# EasyEDA Pro project test_psu.epro, board PowerStagePCB
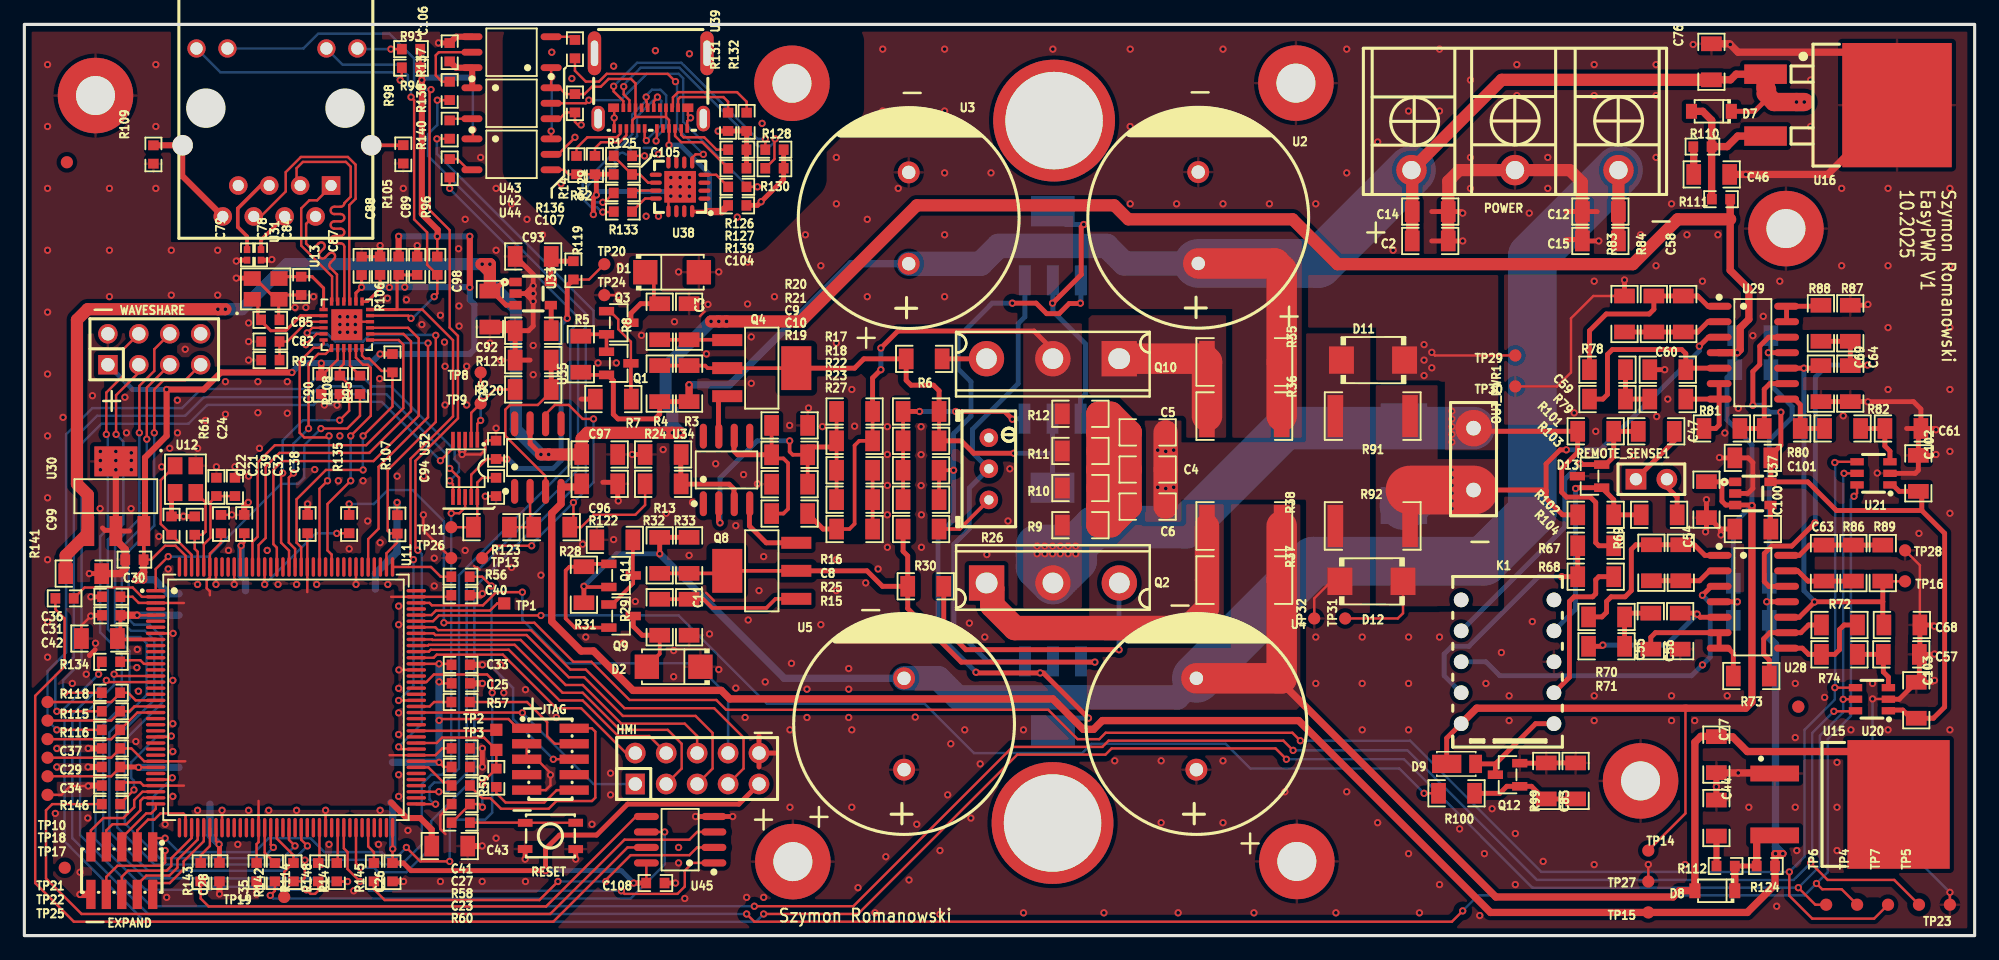
[diagram p0: board, top side]
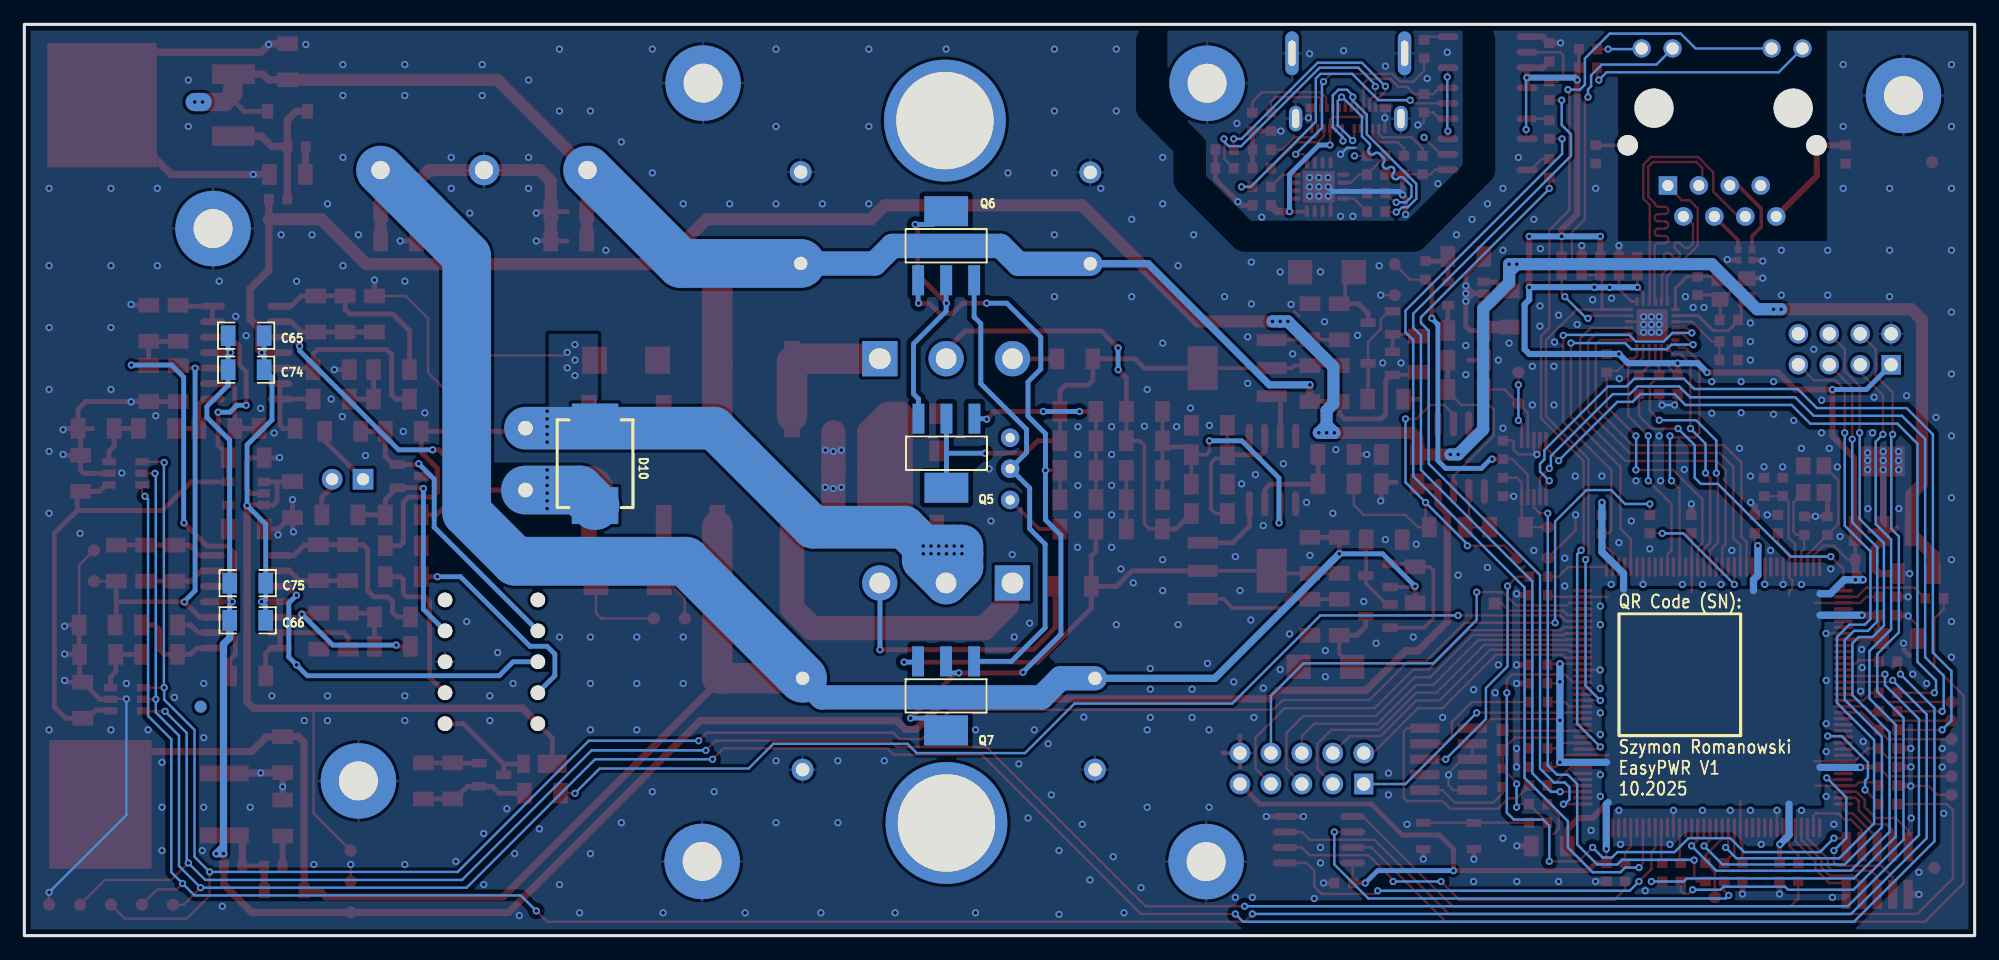
[diagram p1: board, bottom side, seen from below]

Outline 160.15 x 74.8 mm; copper layers: Top Layer, Inner1, Inner2, Bottom Layer. Coordinates in mm from the lower left corner of the outline.
Outline path: rectangle 160.15,0 0,74.8
Stack: Top Layer 0.035mm Outer layer thickness 1oz / Dielectric1 0.2104mm 7628 RC49% 8.6mil / Inner1 0.0152mm Inner layer thickness / Dielectric2 1.065mm 1.1mm H/HOZ Copper / Inner2 0.0152mm Inner layer thickness / Dielectric3 0.2104mm 7628 RC49% 8.6mil / Bottom Layer 0.035mm Outer layer thickness 1oz

## Design rules (mm)
net GND: SlowClass
net GATE_A: FastClass
net VCC-: SlowClass
net VCC+: SlowClass
net GATE_B: FastClass
net $C3_2: SlowClass
net $C4_1: SlowClass
net $C10_1: SlowClass
net $C8_1: SlowClass
net $C10_2: SlowClass
net $C11_1: SlowClass
net $D1_1: SlowClass
net $D2_2: SlowClass
net $Q1_1: SlowClass
net $Q1_3: SlowClass
net $Q2_3: SlowClass
net $Q4_3: SlowClass
net $Q5_1: FastClass
net $Q5_3: FastClass
net $Q6_1: FastClass
net $Q6_3: FastClass
net $Q8_3: SlowClass
net $Q11_3: SlowClass
net $Q11_1: SlowClass
net $Q10_3: SlowClass
net $R26_3: SlowClass
net USETIN: SlowClass
net $R13_1: SlowClass
net $Q2_1: SlowClass
net $Q10_1: SlowClass
net UOH: SlowClass
net UOL: SlowClass
net XOUT: FastClass
net XIN: FastClass
net NRESET: SlowClass
net $C24_2: FastClass
net 3V3: SlowClass
net VDDCORE: SlowClass
net -5V: SlowClass
net +5V: SlowClass
net SWO: SlowClass
net $R56_1: SlowClass
net SWDCLK: SlowClass
net $R57_1: SlowClass
net SWDIO: SlowClass
net $R58_1: SlowClass
net $R59_1: SlowClass
net $R60_1: SlowClass
net $TP1_1: SlowClass
net $TP2_1: SlowClass
net KEY: SlowClass
net SCL: SlowClass
net SDA: SlowClass
net $C55_1: SlowClass
net $C55_2: SlowClass
net $C57_2: SlowClass
net 3V3_REF: SlowClass
net $C61_2: SlowClass
net $C54_2: SlowClass
net $C54_1: SlowClass
net $C56_2: SlowClass
net $C58_2: SlowClass
net $C58_1: SlowClass
net $C59_2: SlowClass
net $C59_1: SlowClass
net $C60_2: SlowClass
net $C63_2: SlowClass
net $C63_1: SlowClass
net $C64_2: SlowClass
net U075: SlowClass
net $R72_2: SlowClass
net $R72_1: SlowClass
net $R80_2: SlowClass
net $R80_1: SlowClass
net $R88_2: SlowClass
net 1V2: SlowClass
net REXT: SlowClass
net $R95_1: SlowClass
net ETHLEDG: SlowClass
net $C78_2: SlowClass
net $C79_2: SlowClass
net $R93_1: SlowClass
net $R94_1: SlowClass
net $R98_1: SlowClass
net LOCAL_SENSE: SlowClass
net LOCAL_GND: SlowClass
net USENSE: SlowClass
net $D9_2: SlowClass
net REMOTE_SENSE: SlowClass
net REMOTE_GND: SlowClass
net SENSE_DIR: SlowClass
net $C83_2: SlowClass
net PD0_PHYRCLK: FastClass
net PC8_LANLED: SlowClass
net PHY_XO: SlowClass
net PHY_XI: SlowClass
net PD9_MDIO: FastClass
net PD8_MDC: FastClass
net PD5_PHYRX0: FastClass
net PD4_PHYAD1: FastClass
net PD7_PHYRXER: SlowClass
net PA14_PHYINT: FastClass
net PD1_PHYTXEN: FastClass
net PD2_PHYTX0: FastClass
net PD3_PHYTX1: FastClass
net PC10_PHYRST: SlowClass
net ETH_RXM-: SlowClass, DP2
net ETH_RXP+: SlowClass, DP2
net ETH_TXM-: SlowClass, DP1
net ETH_TXP+: SlowClass, DP1
net PD6_PHYRX1: FastClass
net $R109_1: SlowClass
net LCD_DC: SlowClass
net LCD_RST: SlowClass
net BLAH: SlowClass
net SPI1_MISO: FastClass
net SPI0_NPCS0: SlowClass
net SPI0_NPCS3: SlowClass
net SPI0_NPCS1: SlowClass
net SPI0_SPCK: SlowClass
net SPI0_MOSI: SlowClass
net SPI0_MISO: FastClass
net SPI0_NPCS2: SlowClass
net $C44_1: SlowClass
net $C46_2: SlowClass
net SSC_TK: SlowClass
net SSC_TF: SlowClass
net SSC_TD: SlowClass
net $C92_2: SlowClass
net $C93_2: SlowClass
net DAC_UREF: SlowClass
net LN_3V3: SlowClass
net $R114_1: SlowClass
net $R115_1: FastClass
net $R116_1: FastClass
net $R118_2: FastClass
net DAC_CLR: SlowClass
net DAC_OUT_B: SlowClass
net $R120_1: SlowClass
net $R122_2: SlowClass
net DAC_OUT_A: SlowClass
net $D7_2: SlowClass
net $D8_1: SlowClass
net $C100_2: SlowClass
net $C105_2: SlowClass
net $R14_1: SlowClass
net USB_DM: SlowClass
net UART_RESET: SlowClass
net $R126_1: SlowClass
net $R127_1: SlowClass
net $R128_1: SlowClass
net $R129_1: SlowClass
net $R130_1: SlowClass
net $R131_2: SlowClass
net $R132_1: SlowClass
net USB_DP: SlowClass
net VBUS: SlowClass
net SUB2: SlowClass
net CC2: SlowClass
net SUB1: SlowClass
net CC1: SlowClass
net DM-: SlowClass, USB
net DP+: SlowClass, USB
net UTXD0: SlowClass
net URXD0: SlowClass
net $R134_1: SlowClass
net ADC_CS2_SPI1_NPCS3: FastClass
net ADC_CS1_SPI1_NPCS2: FastClass
net $R135_1: SlowClass
net ADC_CLK: SlowClass
net HGND: SlowClass
net UTX: SlowClass
net URX: SlowClass
net $R136_2: SlowClass
net $R137_2: SlowClass
net $R138_1: SlowClass
net $R139_1: SlowClass
net $R140_1: SlowClass
net UXRES: SlowClass
net PB1: SlowClass
net PB2: SlowClass
net PB3: SlowClass
net PB4: SlowClass
net PB5: SlowClass
net QSCK: SlowClass
net QIO0: SlowClass
net QIO3: SlowClass
net QIO2: SlowClass
net QCS: SlowClass
net QIO1: SlowClass
net $R145_2: FastClass
net $R146_2: FastClass
net $R141_1: FastClass
net $R142_1: SlowClass
net $R143_1: FastClass
net $R148_1: SlowClass
net $R147_1: SlowClass
net PB8: SlowClass
net PB7: SlowClass
net PB6: SlowClass
net PWMC0_PWMH1: FastClass
net PWMC0_PWML1: FastClass
net AFE0_AD0: FastClass
net PWMC0_PWMH3: SlowClass
net PWMC1_PWMH3: SlowClass
net AFE0_AD1: SlowClass
net PWMC0_PWML3: SlowClass
net PC4_GPIO: SlowClass
net PWMC0_PWML2: SlowClass
template: User Custom Config
spacing copperThickness1oz: track to track 0.203, other pairs 0.152 to 0.508
spacing copperThickness2oz: track to track 0.203, other pairs 0.152 to 0.508
spacing fast: track to track 0.203, other pairs 0.152 to 0.508
spacing slow (default): track to track 0.203, other pairs 0.152 to 0.508
spacing direct: track to track 0.203, other pairs 0.152 to 0.508
track width copperThickness1oz (default): min 0.127, default 0.254, max 4
track width copperThickness2oz: min 0.203, default 0.254, max 4
differential pair differentialPair (default): width min 0.201, default 0.203, max 0.203; gap min 0.201, default 0.203
via viaSize (default): diameter min 0.599, default 0.599, max 10; hole min 0.3, default 0.305, max 5.001
net class FastClass uses FastPlane, fast
net GATE_A uses FastPlane, fast
net GATE_B uses FastPlane, fast
net $Q5_1 uses FastPlane, fast
net $Q5_3 uses FastPlane, fast
net $Q6_1 uses FastPlane, fast
net $Q6_3 uses FastPlane, fast
net XOUT uses FastPlane, fast
net XIN uses FastPlane, fast
net $C24_2 uses FastPlane, fast
net PD0_PHYRCLK uses FastPlane, fast
net PD9_MDIO uses FastPlane, fast
net PD8_MDC uses FastPlane, fast
net PD5_PHYRX0 uses FastPlane, fast
net PD4_PHYAD1 uses FastPlane, fast
net PA14_PHYINT uses FastPlane, fast
net PD1_PHYTXEN uses FastPlane, fast
net PD2_PHYTX0 uses FastPlane, fast
net PD3_PHYTX1 uses FastPlane, fast
net PD6_PHYRX1 uses FastPlane, fast
net SPI1_MISO uses FastPlane, fast
net SPI0_MISO uses FastPlane, fast
net $R115_1 uses FastPlane, fast
net $R116_1 uses FastPlane, fast
net $R118_2 uses FastPlane, fast
net ADC_CS2_SPI1_NPCS3 uses FastPlane, fast
net ADC_CS1_SPI1_NPCS2 uses FastPlane, fast
net $R145_2 uses FastPlane, fast
net $R146_2 uses FastPlane, fast
net $R141_1 uses FastPlane, fast
net $R143_1 uses FastPlane, fast
net PWMC0_PWMH1 uses FastPlane, fast
net PWMC0_PWML1 uses FastPlane, fast
net AFE0_AD0 uses FastPlane, fast
['net class', 'fastclass'] ['NET', 'GND'] uses fast
['net class', 'slowclass'] ['NET', 'GND'] uses default
['net', '$r141 1'] ['NET', 'GND'] uses default
pour e390 uses DirectPlane
pour e729 uses DirectPlane
pour e779 uses DirectPlane
pour e203 uses DirectPlane
pour e630 uses DirectPlane
pour e38315 uses DirectPlane
pour e499 uses DirectPlane

## Placement (name value [footprint] x y rotation side)
C2  10uF  [R1206]  115.44 57.02 180 top
C3  10uF  [R1206]  54.58 50.39 270 top
C4  47nF  [R1206]  92.24 38.26 0 top
C5  47nF  [R1206]  92.24 41.31 0 top
C6  47nF  [R1206]  92.24 35.21 0 top
C8  1nF  [R1206]  62.84 39.47 0 top
C9  47nF  [R1206]  68.17 38.2 0 top
C10  47nF  [R1206]  68.17 35.79 0 top
C11  10uF  [R1206]  54.58 26.14 270 top
C12  10uF  [R1206]  129.41 59.44 180 top
C14  10uF  [R1206]  115.44 59.44 180 top
C15  10uF  [R1206]  129.41 57.02 180 top
C21  12pF  [R0603]  13.99 33.66 270 top
C22  12pF  [R0603]  12.09 33.66 270 top
C23  10nF  [R0603]  35.83 10.8 0 top
C24  10pF  [R0603]  17.29 36.83 270 top
C25  0.1uF  [R0603]  35.83 20.7 180 top
C26  0.1uF  [R0603]  30.23 5.21 90 top
C27  0.1uF  [R0603]  35.83 13.85 180 top
C28  0.1uF  [R0603]  16.02 5.21 90 top
C29  0.1uF  [R0603]  7.11 13.84 0 top
C30  0.1uF  [R0603]  9.04 30.86 0 top
C31  0.1uF  [R0603]  7.13 26.29 0 top
C32  0.1uF  [R0603]  18.05 33.79 270 top
C33  0.1uF  [R0603]  35.83 22.23 180 top
C34  0.1uF  [R0603]  7.11 12.32 0 top
C35  0.1uF  [R0603]  19.07 5.21 90 top
C36  0.1uF  [R0603]  7.13 27.82 0 top
C37  0.1uF  [R0603]  7.11 15.37 0 top
C38  0.1uF  [R0603]  23.26 33.79 270 top
C39  0.1uF  [R0603]  16.15 33.79 270 top
C40  0.1uF  [R0603]  35.81 27.94 180 top
C41  0.1uF  [R0603]  35.83 15.37 180 top
C42  10uF  [R1206]  6.16 24.39 0 top
C43  10uF  [R1206]  34.93 7.35 180 top
C44  10uF  [R1206]  138.94 9.65 90 top
C46  10uF  [R1206]  138.56 62.48 180 top
C47  10uF  [R1206]  138.12 35.79 90 top
C54  10pF  [R1206]  136.02 30.61 90 top
C55  4.7n  [R1206]  133.55 24.99 270 top
C56  4.7n  [R1206]  135.97 24.99 90 top
C57  68n  [R1206]  154.13 23.09 180 top
C58  10pF  [R1206]  136.22 51.03 90 top
C59  4.7n  [R1206]  134.95 44.04 0 top
C60  4.7n  [R1206]  134.95 46.46 0 top
C61  68n  [R1206]  154.25 41.63 180 top
C63  10pF  [R1206]  147.78 30.58 90 top
C64  68n  [R1206]  149.94 45.31 90 top
C65  10uF  [R1206]  141.94 49.25 180 bottom
C66  10uF  [R1206]  141.81 25.88 180 bottom
C68  10uF  [R1206]  154.17 25.5 0 top
C69  10uF  [R1206]  147.52 45.31 270 top
C74  10uF  [R1206]  141.94 46.46 180 bottom
C75  10uF  [R1206]  141.81 28.93 180 bottom
C76  10uF  [R1206]  138.53 71.73 270 top
C77  10uF  [R1206]  138.94 14.86 270 top
C78  100nF  [R0402]  19.43 55.88 90 top
C79  100nF  [R0402]  18.29 55.88 90 top
C82  100pF  [R0603]  20.2 48.77 180 top
C83  68n  [R1206]  127.38 12.7 270 top
C84  12pF  [R0603]  22.73 53.34 90 top
C85  12pF  [R0603]  20.19 50.55 180 top
C87  10uF  [R0603]  27.69 54.98 90 top
C88  10uF  [R0603]  29.21 54.99 90 top
C89  10uF  [R0603]  32.26 54.99 270 top
C90  10uF  [R0603]  24.38 45.21 270 top
C92  47nF  [R1206]  41.78 49.66 0 top
C93  10uF  [R1206]  41.78 55.75 0 top
C94  10uF  [R0603]  38.73 36.83 90 top
C95  10uF  [R0603]  38.73 39.88 270 top
C96  10uF  [R1206]  47.24 37.08 180 top
C97  10uF  [R1206]  47.24 39.5 0 top
C98  10uF  [R1206]  38.23 51.43 90 top
C99  10uF  [R1206]  4.87 29.72 180 top
C100  47nF  [R1206]  141.94 33.38 0 top
C101  10uF  [R1206]  141.94 39.22 0 top
C102  10uF  [R1206]  155.52 37.95 270 top
C103  10uF  [R1206]  155.35 19.32 270 top
C104  1uF  [R0603]  58.54 59.94 0 top
C105  1uF  [R0603]  49.15 62.48 0 top
C106  10uF  [R0603]  34.93 72.52 270 top
C107  10uF  [R0603]  45.21 68.33 90 top
C108  10uF  [R0603]  51.82 4.32 180 top
D1  1SMA5919BT3G  [SMA_L4.3-W2.6-LS5.2-RD]  53.19 54.46 0 top
D2  1SMA5919BT3G  [SMA_L4.3-W2.6-LS5.2-RD]  53.31 22.07 180 top
D7  STPS2H100ZF  [SOD-123_L2.7-W1.6-LS3.7-RD]  138.53 67.67 180 top
D8  STPS2H100ZF  [SOD-123_L2.7-W1.6-LS3.7-RD]  138.81 3.68 180 top
D9  DFLU1200-7  [POWERDI-123_L2.8-W1.8-LS3.7-RD]  117.98 14.1 0 top
D10  SMCJ33CA  [SMC_L6.9-W5.9-LS7.9-BI]  113.28 38.73 90 bottom
D11  SMBJ20CA  [SMB_L4.6-W3.6-LS5.3-BI]  110.74 47.24 0 top
D12  SMBJ20CA  [SMB_L4.6-W3.6-LS5.3-BI]  110.62 29.08 0 top
D13  PESD24VL2BT,215  [SOT-23-3_L2.9-W1.3-P1.90-LS2.4-BR]  128.52 37.72 0 top
EXPAND  20021121-00010T4LF  [HDR-SMD_10P-P1.27-V-M-R2-C5-S1.27-LS5.5]  8 5.33 180 top
F  -  [Mark-Point-1mm]  145.67 18.8 0 top
F1  -  [Mark-Point-1mm]  3.49 63.48 0 top
F2  -  [Mark-Point-1mm]  145.67 18.8 180 bottom
F3  -  [Mark-Point-1mm]  3.32 5.57 0 top
HMI  -  [HDR-TH_10P-P2.54-V-F-R2-C5-S2.54]  55.25 13.72 0 top
JTAG  20021121-00010T4LF  [HDR-SMD_10P-P1.27-V-M-R2-C5-S1.27-LS5.5]  43.2 14.48 270 top
K1  TQ2-5V  [RELAY-TH_TQ2-XXV]  121.79 22.48 90 top
NOREF  -  [Pad_e748]  144.65 58.04 0 top
NOREF#2  -  [Pad_e1478]  84.43 9.25 180 top
NOREF#3  -  [Pad_e680]  5.84 68.96 0 top
NOREF#4  -  [Pad_e671]  63.11 6.08 0 top
NOREF#5  -  [Pad_e1481]  84.56 66.9 180 top
NOREF#6  -  [Pad_e672]  104.49 6.09 0 top
NOREF#7  -  [Pad_e673]  104.41 69.98 0 top
NOREF#8  -  [Pad_e667]  63.03 69.97 0 top
NOREF#9  -  [Pad_e2306]  132.72 12.7 0 top
OUT_PWR1  -  [HDR-TH_2P-P2.54-V-F]  119 37.85 270 top
POWER  MX8500-8.5-03P-GN01-Cu-S-A  [CONN-TH_3P-P8.50_MX8500-8.5-03P-GN01-CU-S-A]  122.4 62.84 0 top
Q1  BC807-25  [SOT-23-3_L2.9-W1.3-P1.90-LS2.4-BR]  48.81 46.98 180 top
Q2  IRFP140NPBF  [TO-247AC-3_L15.8-W5.0-P5.46-L]  84.46 28.95 0 top
Q3  BC807-25  [SOT-23-3_L2.9-W1.3-P1.90-LS2.4-BR]  48.81 50.31 180 top
Q4  FZT853TA  [SOT-223-4_L6.5-W3.5-P2.30-LS7.0-BR]  60.55 46.58 180 top
Q5  FZT853TA  [SOT-223-4_L6.5-W3.5-P2.30-LS7.0-BR]  84.43 39.6 90 bottom
Q6  FZT853TA  [SOT-223-4_L6.5-W3.5-P2.30-LS7.0-BR]  84.45 56.63 270 bottom
Q7  FZT853TA  [SOT-223-4_L6.5-W3.5-P2.30-LS7.0-BR]  84.46 19.68 90 bottom
Q8  FZT953TA  [SOT-223-4_L6.5-W3.5-P2.30-LS7.0-BR]  60.55 29.95 0 top
Q9  BC817-40,215  [SOT-23-3_L2.9-W1.3-P1.90-LS2.4-BR]  49 26.23 180 top
Q10  IRFP9140NPBF  [TO-247AC-3_L15.8-W5.0-P5.46-L]  84.45 47.36 180 top
Q11  BC817-40,215  [SOT-23-3_L2.9-W1.3-P1.90-LS2.4-BR]  49 29.57 180 top
Q12  AO3402  [SOT-23-3_L2.9-W1.3-P0.95-LS2.4-BR]  121.79 13.21 0 top
R3  1.2kΩ  [R1206]  54.58 45.31 270 top
R4  1.2kΩ  [R1206]  52.17 45.31 270 top
R5  470Ω  [R1206]  45.69 47.73 270 top
R6  100Ω  [R1206]  73.89 47.35 0 top
R7  47kΩ  [R1206]  48.36 44.04 0 top
R8  100Ω  [R1206]  52.17 50.39 90 top
R9  100Ω  [R1206]  86.72 33.69 180 top
R10  100Ω  [R1206]  86.72 36.74 180 top
R11  100Ω  [R1206]  86.72 39.79 180 top
R12  100Ω  [R1206]  86.72 42.83 180 top
R13  100Ω  [R1206]  52.45 37.08 180 top
R14  49.9Ω  [R0603]  45.34 63.25 270 top
R15  1.2kΩ  [R1206]  62.84 34.65 0 top
R16  100Ω  [R1206]  62.84 41.88 180 top
R17  47kΩ  [R1206]  73.63 43.03 0 top
R18  47kΩ  [R1206]  73.63 40.61 0 top
R19  10kΩ  [R1206]  68.17 33.38 180 top
R20  47kΩ  [R1206]  68.17 43.03 0 top
R21  47kΩ  [R1206]  68.17 40.61 0 top
R22  47kΩ  [R1206]  73.63 38.2 180 top
R23  47kΩ  [R1206]  73.63 35.79 180 top
R24  10kΩ  [R1206]  52.45 39.5 0 top
R25  1.2kΩ  [R1206]  62.84 37.06 0 top
R26  500R  [RES-ADJ-TH_3296W]  79.2 38.32 0 top
R27  100Ω  [R1206]  73.63 33.38 0 top
R28  47kΩ  [R1206]  48.49 32.49 180 top
R29  100Ω  [R1206]  52.17 26.14 270 top
R30  100Ω  [R1206]  74.02 28.68 0 top
R31  470Ω  [R1206]  45.95 28.8 90 top
R32  1.2kΩ  [R1206]  52.17 31.22 270 top
R33  1.2kΩ  [R1206]  54.58 31.22 270 top
R35  470mΩ  [R2512]  100.18 47.09 0 top
R36  470mΩ  [R2512]  100.18 42.65 0 top
R37  470mΩ  [R2512]  100.18 29.18 180 top
R38  470mΩ  [R2512]  100.18 33.63 180 top
R56  49.9Ω  [R0603]  35.81 29.46 180 top
R57  49.9Ω  [R0603]  35.82 19.18 180 top
R58  49.9Ω  [R0603]  35.83 12.32 180 top
R59  49.9Ω  [R0603]  38.76 12.96 90 top
R60  49.9Ω  [R0603]  35.83 9.27 180 top
R61  5.62kΩ  [R0603]  15.77 36.83 270 top
R62  49.9Ω  [R0603]  49.15 60.96 0 top
R67  91kΩ  [R1206]  129.03 32 0 top
R68  10kΩ  [R1206]  129.03 29.46 180 top
R69  100Ω  [R1206]  133.6 30.61 90 top
R70  680Ω  [R1206]  129.92 26.16 0 top
R71  680Ω  [R1206]  129.92 23.75 180 top
R72  10kΩ  [R1206]  149.05 25.5 180 top
R73  10kΩ  [R1206]  141.81 21.31 180 top
R74  49.9Ω  [R1206]  149.05 23.09 0 top
R78  680Ω  [R1206]  130 46.46 0 top
R79  680Ω  [R1206]  130 44.04 180 top
R80  10kΩ  [R1206]  144.35 41.63 180 top
R81  10kΩ  [R1206]  139.39 41.63 180 top
R82  49.9Ω  [R1206]  149.3 41.63 0 top
R83  22.1Ω  [R1206]  131.39 51.03 270 top
R84  1kΩ  [R1206]  133.81 51.03 90 top
R86  100Ω  [R1206]  150.19 30.58 90 top
R87  1.5kΩ  [R1206]  149.94 50.27 270 top
R88  5.1kΩ  [R1206]  147.52 50.27 90 top
R89  100Ω  [R1206]  152.6 30.58 270 top
R91  20mΩ  [R2512]  110.72 42.65 0 top
R92  20mΩ  [R2512]  110.72 33.63 0 top
R93  1kΩ  [R0603]  31.75 72.77 0 top
R94  1kΩ  [R0603]  31.75 71.25 0 top
R95  39Ω  [R0603]  27.56 45.21 270 top
R96  10kΩ  [R0603]  33.91 54.99 90 top
R97  6.49kΩ  [R0603]  20.2 47.24 180 top
R98  39Ω  [R0603]  31.12 64.13 270 top
R99  10kΩ  [R1206]  124.97 12.7 90 top
R100  100Ω  [R1206]  117.6 11.68 180 top
R101  100Ω  [R1206]  134 41.4 0 top
R102  100Ω  [R1206]  134.24 34.54 0 top
R103  1kΩ  [R1206]  129.03 41.4 0 top
R104  1kΩ  [R1206]  129.03 34.54 0 top
R105  10kΩ  [R0603]  30.73 54.99 90 top
R106  1kΩ  [R0603]  30.23 46.99 90 top
R107  1.5kΩ  [G0603]  30.61 33.78 90 top
R108  10kΩ  [R0603]  25.91 45.21 90 top
R109  39Ω  [R0603]  10.6 64.12 270 top
R110  4.7Ω  [R0603]  137.8 64.77 0 top
R111  4.7Ω  [R0603]  139.32 60.45 180 top
R112  4.7Ω  [R0603]  139.7 5.72 180 top
R114  49.9Ω  [R0603]  22.1 5.21 90 top
R115  49.9Ω  [R0603]  7.11 18.41 0 top
R116  49.9Ω  [R0603]  7.11 16.89 0 top
R118  49.9Ω  [R0603]  7.11 19.94 180 top
R119  4.7Ω  [R0603]  45.09 54.61 90 top
R120  10kΩ  [R1206]  41.78 44.83 180 top
R121  10kΩ  [R1206]  41.78 47.24 180 top
R122  10kΩ  [R1206]  43.31 33.53 180 top
R123  10kΩ  [R1206]  38.35 33.53 180 top
R124  4.7Ω  [R0603]  143 5.72 180 top
R125  49.9Ω  [R0603]  49.15 64.01 0 top
R126  49.9Ω  [R0603]  58.55 64.52 0 top
R127  49.9Ω  [R0603]  58.55 62.99 0 top
R128  49.9Ω  [R0603]  61.6 64.52 0 top
R129  49.9Ω  [R0603]  46.85 63.25 270 top
R130  49.9Ω  [R0603]  61.6 62.99 0 top
R131  49.9Ω  [R0603]  57.79 66.8 90 top
R132  49.9Ω  [R0603]  59.31 66.8 270 top
R133  49.9Ω  [R0603]  49.15 59.44 0 top
R134  49.9Ω  [R0603]  7.11 22.48 180 top
R135  49.9Ω  [R0603]  26.67 33.78 90 top
R136  1.5kΩ  [R0603]  45.21 72.77 90 top
R137  39Ω  [R0603]  34.93 69.34 90 top
R138  1.5kΩ  [R0603]  34.93 66.17 270 top
R139  39Ω  [R0603]  58.55 61.47 180 top
R140  1.5kΩ  [R0603]  34.93 62.99 270 top
R141  49.9Ω  [R0603]  3.3 27.69 0 top
R142  49.9Ω  [R0603]  20.57 5.21 90 top
R143  49.9Ω  [R0603]  14.48 5.21 90 top
R145  49.9Ω  [R0603]  28.7 5.21 270 top
R146  49.9Ω  [R0603]  7.11 10.79 180 top
R147  39Ω  [R0603]  25.65 5.21 270 top
R148  39Ω  [R0603]  24.13 5.21 270 top
REMOTE_SENSE1  -  [HDR-TH_2P-P2.54-V-F#2]  133.6 37.46 0 top
RESET  PTS810SJG250SMTRLFS  [SW-SMD_4P_PTS810SJM250SMTRLFS]  43.2 8.18 180 top
RJ1  HR913129AE  [RJ45-TH_HR913129A]  20.74 65.93 0 top
TP1  -  [Test-Point-0.5mm#2]  39.41 27.27 270 top
TP2  -  [Test-Point-0.5mm#2]  38.76 16.89 270 top
TP3  -  [Test-Point-0.5mm#2]  38.76 15.24 270 top
TP4  -  [Test-Point-0.5mm]  150.5 2.54 0 top
TP5  -  [Test-Point-0.5mm]  155.57 2.54 0 top
TP6  -  [Test-Point-0.5mm]  147.95 2.54 0 top
TP7  -  [Test-Point-0.5mm]  153.04 2.54 0 top
TP8  -  [Test-Point-0.5mm]  37.47 46.23 0 top
TP9  -  [Test-Point-0.5mm]  37.47 43.69 0 top
TP10  -  [Test-Point-0.5mm]  1.91 19.18 0 top
TP11  -  [Test-Point-0.5mm]  35.05 33.53 0 top
TP13  -  [Test-Point-0.5mm]  37.59 30.99 0 top
TP14  -  [Test-Point-0.5mm]  133.35 6.98 0 top
TP15  -  [Test-Point-0.5mm]  133.35 1.91 0 top
TP16  -  [Test-Point-0.5mm]  154.43 29.08 0 top
TP17  -  [Test-Point-0.5mm]  1.91 16.13 0 top
TP18  -  [Test-Point-0.5mm]  1.91 17.65 0 top
TP19  -  [Test-Point-0.5mm]  21.34 3.17 0 top
TP20  -  [Test-Point-0.5mm]  47.62 55.12 0 top
TP21  -  [Test-Point-0.5mm]  1.91 14.6 0 top
TP22  -  [Test-Point-0.5mm]  1.91 13.08 0 top
TP23  -  [Test-Point-0.5mm]  158.12 2.54 0 top
TP24  -  [Test-Point-0.5mm]  47.62 52.58 0 top
TP25  -  [Test-Point-0.5mm]  1.91 11.56 0 top
TP26  -  [Test-Point-0.5mm]  35.05 30.99 0 top
TP27  -  [Test-Point-0.5mm]  133.35 4.44 0 top
TP28  -  [Test-Point-0.5mm]  154.43 31.62 0 top
TP29  -  [Test-Point-0.5mm]  122.43 47.62 90 top
TP30  -  [Test-Point-0.5mm]  122.43 45.08 90 top
TP31  -  [Test-Point-0.5mm]  108.46 26.03 0 top
TP32  -  [Test-Point-0.5mm]  105.92 26.03 0 top
U2  4700uF  [CAP-TH_BD18.0-P7.5-D0.8-FD]  96.39 58.93 90 top
U3  4700uF  [CAP-TH_BD18.0-P7.5-D0.8-FD]  72.62 58.9 90 top
U4  4700uF  [CAP-TH_BD18.0-P7.5-D0.8-FD]  96.24 17.37 90 top
U5  4700uF  [CAP-TH_BD18.0-P7.5-D0.8-FD]  72.24 17.37 90 top
U11  -  [LQFP-144_20.0X20.0X0.5P]  21.48 19.56 270 top
U12  12MHz  [CRYSTAL-SMD_4P-L3.2-W2.5-BL]  13.23 37.47 270 top
U13  KSZ8081RNACA-TR  [QFN-24_L4.0-W4.0-P0.50-BL-EP2.6]  26.48 50.14 180 top
U15  L7905CD2T-TR  [TO-263-2_L10.0-W9.1-P5.08-LS15.2-TL]  148.81 10.77 0 top
U16  L7805ABD2T-TR  [TO-263-2_L10.0-W9.2-P5.08-LS15.3-TL-CW]  148.37 68.17 0 top
U20  AD7680ARJZ-REEL7  [SOT-23-6_L2.9-W1.6-P0.95-LS2.8-BR]  151.71 19.41 0 top
U21  AD7680ARJZ-REEL7  [SOT-23-6_L2.9-W1.6-P0.95-LS2.8-BR]  151.84 37.95 0 top
U28  OPA4197IDR  [SOIC-14_L8.7-W3.9-P1.27-LS6.0-BL]  141.94 27.41 270 top
U29  OPA4197IDR  [SOIC-14_L8.7-W3.9-P1.27-LS6.0-BL]  141.94 47.85 270 top
U30  MCP1825ST-3302E/DB  [SOT-223_L6.5-W3.5-P2.30-LS7.0-BR]  7.51 36.07 270 top
U31  25MHz  [CRYSTAL-SMD_4P-L3.2-W2.5-BL]  19.81 53.09 0 top
U32  DAC8562TDGSR  [VSSOP-10_L3.0-W3.0-P0.50-LS4.9-BL]  36.2 38.35 180 top
U33  NCP700BSN33T1G  [TSOP-5_L3.0-W1.5-P0.95-LS2.8-BR]  41.78 52.7 180 top
U34  OPA197IDR  [SOIC-8_L4.9-W3.9-P1.27-LS6.0-BL]  57.66 38.23 0 top
U35  OPA197IDR  [SOIC-8_L4.9-W3.9-P1.27-LS6.0-BL]  42.16 39.24 0 top
U37  NCP700BSN33T1G  [TSOP-5_L3.0-W1.5-P0.95-LS2.8-BR]  141.94 36.3 180 top
U38  MCP2221AT-I/ML  [QFN-16_L4.0-W4.0-P0.65-TL-EP2.6]  53.85 61.47 180 top
U39  2012670005  [USB-C-SMD_2012670005]  51.44 69.34 180 top
U42  TLP2368(TPL,E(T  [SOP-6_5P-L4.4-W3.6-P1.27-LS7.0-BR-PE2]  40.01 68.33 180 top
U43  TLP2368(TPL,E(T  [SOP-6_5P-L4.4-W3.6-P1.27-LS7.0-BR-PE2]  40.01 72.52 0 top
U44  TLP2368(TPL,E(T  [SOP-6_5P-L4.4-W3.6-P1.27-LS7.0-BR-PE2]  40.01 64.13 180 top
U45  IS66WVS4M8BLL-104NLI-TR  [SOIC-8_L4.9-W3.9-P1.27-LS6.0-BL]  53.85 7.87 90 top
WAVESHARE  -  [HDR-TH_8P-P2.54-V-F-R2-C4-S2.54-1]  10.67 48.13 0 top

## Footprints (pads in the part's own frame, mm; a bottom-side part is the same pattern mirrored in y, then rotated)
CAP-TH_BD18.0-P7.5-D0.8-FD
  round 1.8 hole 1.1: 1(-3.75,0) 2(3.75,0)
CONN-TH_3P-P8.50_MX8500-8.5-03P-GN01-CU-S-A
  round 2.5 hole 1.5: 1(-8.499,0) 2(0,0) 3(8.499,0)
CRYSTAL-SMD_4P-L3.2-W2.5-BL
  rect 1.4x1.2 smd: 1(-1.1,-0.85) 2(1.1,-0.85) 3(1.1,0.85) 4(-1.1,0.85)
G0603
  rect 0.806x0.864 smd: 1(-0.779,-0.025) 2(0.728,-0.025)
HDR-SMD_10P-P1.27-V-M-R2-C5-S1.27-LS5.5
  rect 0.76x2.4 smd: 1(-2.54,-1.95) 2(-2.54,1.95) 3(-1.27,-1.95) 4(-1.27,1.95) 5(0,-1.95) 6(0,1.95) 7(1.27,-1.95) 8(1.27,1.95) 9(2.54,-1.95) 10(2.54,1.95)
HDR-TH_2P-P2.54-V-F
  round 3 hole 1.2: 1(-3.81,0) 2(1.27,0)
HDR-TH_2P-P2.54-V-F#2
  rect 1.7x1.7 hole 1: 1(-1.27,0)
  round 1.7 hole 1: 2(1.27,0)
HDR-TH_8P-P2.54-V-F-R2-C4-S2.54-1
  rect 1.6x1.6 hole 1.1: 1(-3.81,-1.27)
  round 1.6 hole 1.1: 2(-3.81,1.27) 3(-1.27,-1.27) 4(-1.27,1.27) 5(1.27,-1.27) 6(1.27,1.27) 7(3.81,-1.27) 8(3.81,1.27)
HDR-TH_10P-P2.54-V-F-R2-C5-S2.54
  rect 1.575x1.7 hole 1.1: 1(-5.08,-1.27)
  round 1.7 hole 1.1: 2(-5.08,1.27) 3(-2.54,-1.27) 4(-2.54,1.27) 5(0,-1.27) 6(0,1.27) 7(2.54,-1.27) 8(2.54,1.27) 9(5.08,-1.27) 10(5.08,1.27)
LQFP-144_20.0X20.0X0.5P
  oval 0.28x1.6 smd: 1(-8.75,-10.7) 2(-8.25,-10.7) 3(-7.75,-10.7) 4(-7.25,-10.7) 5(-6.75,-10.7) 6(-6.25,-10.7) 7(-5.75,-10.7) 8(-5.25,-10.7) 9(-4.75,-10.7) 10(-4.25,-10.7) 11(-3.75,-10.7) 12(-3.25,-10.7) 13(-2.75,-10.7) 14(-2.25,-10.7) 15(-1.75,-10.7) 16(-1.25,-10.7) 17(-0.75,-10.7) 18(-0.25,-10.7) 19(0.25,-10.7) 20(0.75,-10.7) 21(1.25,-10.7) 22(1.75,-10.7) 23(2.25,-10.7) 24(2.75,-10.7) 25(3.25,-10.7) 26(3.75,-10.7) 27(4.25,-10.7) 28(4.75,-10.7) 29(5.25,-10.7) 30(5.75,-10.7) 31(6.25,-10.7) 32(6.75,-10.7) 33(7.25,-10.7) 34(7.75,-10.7) 35(8.25,-10.7) 36(8.75,-10.7) 73(8.75,10.7) 74(8.25,10.7) 75(7.75,10.7) 76(7.25,10.7) 77(6.75,10.7) 78(6.25,10.7) 79(5.75,10.7) 80(5.25,10.7) 81(4.75,10.7) 82(4.25,10.7) 83(3.75,10.7) 84(3.25,10.7) 85(2.75,10.7) 86(2.25,10.7) 87(1.75,10.7) 88(1.25,10.7) 89(0.75,10.7) 90(0.25,10.7) 91(-0.25,10.7) 92(-0.75,10.7) 93(-1.25,10.7) 94(-1.75,10.7) 95(-2.25,10.7) 96(-2.75,10.7) 97(-3.25,10.7) 98(-3.75,10.7) 99(-4.25,10.7) 100(-4.75,10.7) 101(-5.25,10.7) 102(-5.75,10.7) 103(-6.25,10.7) 104(-6.75,10.7) 105(-7.25,10.7) 106(-7.75,10.7) 107(-8.25,10.7) 108(-8.75,10.7)
  oval 1.6x0.28 smd: 37(10.7,-8.75) 38(10.7,-8.25) 39(10.7,-7.75) 40(10.7,-7.25) 41(10.7,-6.75) 42(10.7,-6.25) 43(10.7,-5.75) 44(10.7,-5.25) 45(10.7,-4.75) 46(10.7,-4.25) 47(10.7,-3.75) 48(10.7,-3.25) 49(10.7,-2.75) 50(10.7,-2.25) 51(10.7,-1.75) 52(10.7,-1.25) 53(10.7,-0.75) 54(10.7,-0.25) 55(10.7,0.25) 56(10.7,0.75) 57(10.7,1.25) 58(10.7,1.75) 59(10.7,2.25) 60(10.7,2.75) 61(10.7,3.25) 62(10.7,3.75) 63(10.7,4.25) 64(10.7,4.75) 65(10.7,5.25) 66(10.7,5.75) 67(10.7,6.25) 68(10.7,6.75) 69(10.7,7.25) 70(10.7,7.75) 71(10.7,8.25) 72(10.7,8.75) 109(-10.7,8.75) 110(-10.7,8.25) 111(-10.7,7.75) 112(-10.7,7.25) 113(-10.7,6.75) 114(-10.7,6.25) 115(-10.7,5.75) 116(-10.7,5.25) 117(-10.7,4.75) 118(-10.7,4.25) 119(-10.7,3.75) 120(-10.7,3.25) 121(-10.7,2.75) 122(-10.7,2.25) 123(-10.7,1.75) 124(-10.7,1.25) 125(-10.7,0.75) 126(-10.7,0.25) 127(-10.7,-0.25) 128(-10.7,-0.75) 129(-10.7,-1.25) 130(-10.7,-1.75) 131(-10.7,-2.25) 132(-10.7,-2.75) 133(-10.7,-3.25) 134(-10.7,-3.75) 135(-10.7,-4.25) 136(-10.7,-4.75) 137(-10.7,-5.25) 138(-10.7,-5.75) 139(-10.7,-6.25) 140(-10.7,-6.75) 141(-10.7,-7.25) 142(-10.7,-7.75) 143(-10.7,-8.25) 144(-10.7,-8.75)
Mark-Point-1mm
  round 1 smd: 1(0,0)
Pad_e667
  round 6.2 hole 3.2: 1(0,0)
Pad_e671
  round 6.2 hole 3.2: 1(0,0)
Pad_e672
  round 6.2 hole 3.2: 1(0,0)
Pad_e673
  round 6.2 hole 3.2: 1(0,0)
Pad_e680
  round 6.2 hole 3.2: 1(0,0)
Pad_e748
  round 6.2 hole 3.2: 1(0,0)
Pad_e1478
  round 10 hole 8: 1(0,0)
Pad_e1481
  round 10 hole 8: 1(0,0)
Pad_e2306
  round 6.2 hole 3.2: 1(0,0)
POWERDI-123_L2.8-W1.8-LS3.7-RD
  rect 2.4x1.5 smd: 1(-1.188,0)
  rect 1.05x1.5 smd: 2(1.188,0)
QFN-16_L4.0-W4.0-P0.65-TL-EP2.6
  oval 1x0.35 smd: 1(-2,0.965) 2(-2,0.315) 3(-2,-0.336) 4(-2,-0.986) 9(2,-0.991) 10(2,-0.341) 11(2,0.31) 12(2,0.96)
  oval 0.35x1 smd: 5(-0.991,-2) 6(-0.341,-2) 7(0.31,-2) 8(0.96,-2) 13(0.96,2) 14(0.31,2) 15(-0.341,2) 16(-0.991,2)
  rect 2.6x2.6 smd: 17(0,0)
QFN-24_L4.0-W4.0-P0.50-BL-EP2.6
  rect 0.28x0.665 smd: 1(-1.25,-1.907) 2(-0.75,-1.907) 3(-0.25,-1.907) 4(0.25,-1.907) 5(0.75,-1.907) 6(1.25,-1.907) 13(1.25,1.907) 14(0.75,1.907) 15(0.25,1.907) 16(-0.25,1.907) 17(-0.75,1.907) 18(-1.25,1.907)
  rect 0.665x0.28 smd: 7(1.907,-1.25) 8(1.907,-0.75) 9(1.907,-0.25) 10(1.907,0.25) 11(1.907,0.75) 12(1.907,1.25) 19(-1.907,1.25) 20(-1.907,0.75) 21(-1.907,0.25) 22(-1.907,-0.25) 23(-1.907,-0.75) 24(-1.907,-1.25)
  rect 2.55x2.55 smd: 25(0,0)
R0402
  rect 0.566x0.54 smd: 1(-0.433,0) 2(0.433,0)
R0603
  rect 0.806x0.864 smd: 1(-0.753,0) 2(0.753,0)
R1206
  rect 1.208x1.701 smd: 1(-1.479,0) 2(1.479,0)
R2512
  rect 1.282x3.456 smd: 1(-3.067,0) 2(3.067,0)
RELAY-TH_TQ2-XXV
  round 1.2 hole 1.2x0.8: 1(-5.08,-3.81) 2(-2.54,-3.81) 3(0,-3.81) 4(2.54,-3.81) 5(5.08,-3.81) 6(5.08,3.81) 7(2.54,3.81) 8(0,3.81) 9(-2.54,3.81) 10(-5.08,3.81)
RES-ADJ-TH_3296W
  round 1.524 hole 0.762: 1(0,2.55) 2(0,0.01) 3(0,-2.55)
RJ45-TH_HR913129A
  rect 1.524x1.524 hole 0.914: 1(4.445,-4.355)
  round 1.524 hole 0.914: 2(3.175,-6.895) 3(1.905,-4.355) 4(0.635,-6.895) 5(-0.635,-4.355) 6(-1.905,-6.895) 7(-3.175,-4.355) 8(-4.445,-6.895)
  round 1.498 hole 1.016: 9(6.604,6.895) 10(4.064,6.895) 11(-4.064,6.895) 12(-6.604,6.895)
  round 1.702 hole 1.677: 13(7.747,-1.053) 14(-7.747,-1.053)
SMA_L4.3-W2.6-LS5.2-RD
  rect 2x2 smd: 1(-2.2,0) 2(2.2,0)
SMB_L4.6-W3.6-LS5.3-BI
  rect 2.047x2.241 smd: 1(-2.591,0) 2(2.591,0)
SMC_L6.9-W5.9-LS7.9-BI
  rect 3.03x3.82 smd: 1(-3.435,0) 2(3.435,0)
SOD-123_L2.7-W1.6-LS3.7-RD
  rect 0.91x1.22 smd: 1(-1.635,0) 2(1.635,0)
SOIC-8_L4.9-W3.9-P1.27-LS6.0-BL
  oval 0.588x2.045 smd: 1(-1.905,-2.772) 2(-0.635,-2.772) 3(0.635,-2.772) 4(1.905,-2.772) 5(1.905,2.772) 6(0.635,2.772) 7(-0.635,2.772) 8(-1.905,2.772)
SOIC-14_L8.7-W3.9-P1.27-LS6.0-BL
  oval 0.574x2.038 smd: 1(-3.81,-2.769) 2(-2.54,-2.769) 3(-1.27,-2.769) 4(0,-2.769) 5(1.27,-2.769) 6(2.54,-2.769) 7(3.81,-2.769) 8(3.81,2.769) 9(2.54,2.769) 10(1.27,2.769) 11(0,2.769) 12(-1.27,2.769) 13(-2.54,2.769) 14(-3.81,2.769)
SOP-6_5P-L4.4-W3.6-P1.27-LS7.0-BR-PE2
  oval 1.727x0.56 smd: 1(3.251,-1.27) 3(3.251,1.27) 4(-3.251,1.27) 5(-3.251,0) 6(-3.251,-1.27)
SOT-23-3_L2.9-W1.3-P0.95-LS2.4-BR
  rect 1.25x0.7 smd: 1(1,-0.95) 2(1,0.95) 3(-1,0)
SOT-23-3_L2.9-W1.3-P1.90-LS2.4-BR
  rect 1.25x0.7 smd: 1(1,-0.95) 2(1,0.95) 3(-1,0)
SOT-23-6_L2.9-W1.6-P0.95-LS2.8-BR
  rect 1.1x0.6 smd: 1(1.35,-0.95) 2(1.35,0) 3(1.35,0.95) 4(-1.35,0.95) 5(-1.35,0) 6(-1.35,-0.95)
SOT-223-4_L6.5-W3.5-P2.30-LS7.0-BR
  rect 2.47x0.98 smd: 1(2.835,-2.3) 2(2.835,0) 3(2.835,2.3)
  rect 2.47x3.6 smd: 4(-2.835,0)
SOT-223_L6.5-W3.5-P2.30-LS7.0-BR
  rect 2.465x1.05 smd: 1(2.857,-2.3) 2(2.857,0) 3(2.857,2.3)
  rect 2.465x3.54 smd: 4(-2.857,0)
SW-SMD_4P_PTS810SJM250SMTRLFS
  rect 1.2x0.65 smd: 1(-2.078,1.083) 2(2.078,1.075) 3(-2.077,-1.083) 4(2.071,-1.075)
Test-Point-0.5mm
  round 1 smd: 1(0,0)
Test-Point-0.5mm#2
  rect 1x1 smd: 1(0,0)
TO-247AC-3_L15.8-W5.0-P5.46-L
  rect 2.9x2.9 hole 1.785x1.7: 1(-5.45,0)
  round 2.9 hole 1.7: 2(0,0) 3(5.45,0)
TO-263-2_L10.0-W9.1-P5.08-LS15.2-TL
  rect 4x1.3 smd: 1(-5.086,2.54) 3(-5.086,-2.54)
  rect 8.4x10.566 smd: 4(5.086,0)
TO-263-2_L10.0-W9.2-P5.08-LS15.3-TL-CW
  rect 3.5x1.6 smd: 1(-5.397,2.54) 3(-5.397,-2.54)
  rect 9x10.2 smd: 2(5.397,0)
TSOP-5_L3.0-W1.5-P0.95-LS2.8-BR
  rect 1x0.7 smd: 1(1.448,-0.95) 2(1.448,0) 3(1.448,0.95) 4(-1.448,0.95) 5(-1.448,-0.95)
USB-C-SMD_2012670005
  oval 1.1x2.1 hole 0.6x1.6: 1(4.32,2.275) 2(-4.32,2.275)
  oval 1.1x3.6 hole 0.6x2.1: 3(-4.62,-3.085) 4(4.62,-3.085)
  rect 0.3x0.7 smd: A1(-3,3.085) A2(-2.5,3.085) A3(-2,3.085) A4(-1.5,3.085) A5(-1,3.085) A6(-0.5,3.085) A7(0.5,3.085) A8(1,3.085) A9(1.5,3.085) A10(2,3.085) A11(2.5,3.085) A12(3,3.085) B2(2.25,1.385) B3(1.75,1.385) B4(1.25,1.385) B5(0.75,1.385) B6(0.25,1.385) B7(-0.25,1.385) B8(-0.75,1.385) B9(-1.25,1.385) B10(-1.75,1.385) B11(-2.25,1.385)
  rect 0.9x0.7 smd: B1(3.05,1.385) B12(-3.05,1.385)
VSSOP-10_L3.0-W3.0-P0.50-LS4.9-BL
  rect 0.3x1.3 smd: 1(-1,-2.35) 2(-0.5,-2.35) 3(0,-2.35) 4(0.5,-2.35) 5(1,-2.35) 6(1,2.35) 7(0.5,2.35) 8(0,2.35) 9(-0.5,2.35) 10(-1,2.35)

## Nets
1V2: C88.1 U13.1
3V3: C25.2 C26.2 C27.2 C28.2 C29.2 C30.2 C31.2 C32.2 C33.2 C42.2 C87.1 C90.1 C106.2 C108.2 HMI.9 JTAG.1 R93.2 R94.2 R96.2 R105.2 R106.2 R107.2 TP22.1 U11.5 U11.9 U11.30 U11.43 U11.72 U11.80 U11.96 U11.134 U11.143 U13.2 U13.14 U30.3 U42.1 U43.6 U44.1 U45.8 WAVESHARE.1
3V3_REF: C101.2 C102.2 C103.2 U20.1 U21.1 U29.12 U37.5
+5V: C47.2 C65.2 C66.2 C74.2 C75.2 C97.1 C98.2 C99.2 D9.1 K1.10 R111.1 TP14.1 U28.4 U29.4 U30.1 U33.1 U33.3 U35.7 U37.1 U37.3
-5V: C65.1 C66.1 C74.1 C75.1 C96.2 R124.1 TP15.1 U28.11 U29.11 U35.4
GND: C2.1 C3.1 C4.2 C5.2 C6.2 C11.2 C12.2 C14.1 C15.2 C21.1 C22.1 C23.1 C24.1 C25.1 C26.1 C27.1 C28.1 C29.1 C30.1 C31.1 C32.1 C33.1 C34.1 C35.1 C36.1 C37.1 C38.1 C39.1 C40.1 C41.1 C42.1 C43.1 C44.2 C46.1 C47.1 C56.1 C57.1 C60.1 C61.1 C64.1 C68.2 C69.2 C76.1 C77.2 C78.1 C79.1 C82.2 C83.1 C84.1 C85.1 C87.2 C88.2 C89.1 C90.2 C92.1 C93.1 C94.1 C95.1 C96.1 C97.2 C98.1 C99.1 C100.1 C101.1 C102.1 C103.1 C106.1 C108.1 D1.2 D2.1 D11.1 D12.1 D13.3 EXPAND.10 HMI.10 JTAG.3 JTAG.5 JTAG.9 K1.3 NOREF.1 NOREF#3.1 NOREF#4.1 NOREF#6.1 NOREF#7.1 NOREF#9.1 POWER.2 Q12.2 R7.1 R16.1 R24.1 R25.1 R28.2 R61.1 R83.1 R87.1 R91.1 R92.1 R97.2 R98.2 R99.2 R108.1 R109.2 R121.2 RESET.1 RESET.2 TP23.1 TP24.1 TP25.1 TP26.1 TP27.1 TP28.1 TP30.1 TP32.1 U2.2 U3.2 U4.1 U5.1 U11.8 U11.44 U11.61 U11.95 U11.115 U11.135 U11.138 U12.2 U12.4 U13.22 U13.25 U15.1 U16.2 U20.2 U21.2 U30.2 U30.4 U31.2 U31.4 U32.3 U32.4 U33.2 U37.2 U43.4 U45.4 WAVESHARE.2
VBUS: C104.1 C107.2 U38.16 U39.A4 U39.A9 U39.B4 U39.B9 U42.6 U43.1 U44.6
VCC+: C2.2 C14.2 C76.2 D7.1 POWER.1 Q1.2 R3.2 R4.2 R5.2 R35.2 R36.2 U2.1 U3.1 U16.1
VCC-: C12.1 C15.1 C77.1 D8.2 POWER.3 Q11.2 R31.1 R32.1 R33.1 R37.1 R38.1 U4.2 U5.2 U15.4
VDDCORE: C34.2 C35.2 C36.2 C37.2 C38.2 C39.2 C40.2 C41.2 C43.2 TP21.1 U11.3 U11.29 U11.33 U11.50 U11.81 U11.107 U11.123 U11.139
$C3_2: C3.2 Q4.1 R8.1
$C4_1: C4.1 C5.1 C6.1 R9.1 R10.1 R11.1 R12.1
$C8_1: C8.1 R15.1 R16.2 U34.6
$C10_1: C8.2 C9.1 C10.1 R20.1 R21.1 R25.2 U34.2
$C10_2: C9.2 C10.2 R19.1
$C11_1: C11.1 Q8.1 R29.1
$C24_2: C24.2 R61.2 U11.140
$C44_1: C44.1 R112.2
$C46_2: C46.2 R110.1
$C54_1: C54.1 R69.1 U28.2
$C54_2: C54.2 R69.2 R70.1 U28.1
$C55_1: C55.1 R70.2 R71.1
$C55_2: C55.2 R73.2 U28.6 U28.7
$C56_2: C56.2 R71.2 U28.5
$C57_2: C57.2 R74.2 U20.3
$C58_1: C58.1 R83.2 R84.1 U29.2
$C58_2: C58.2 R78.1 R84.2 U29.1
$C59_1: C59.1 R78.2 R79.1
$C59_2: C59.2 R81.2 U29.6 U29.7
$C60_2: C60.2 R79.2 U29.5
$C61_2: C61.2 R82.2 U21.3
$C63_1: C63.1 R86.1 U28.13
$C63_2: C63.2 R86.2 R89.1 U28.14
$C64_2: C64.2 R87.2 R88.1 U28.12
$C78_2: C78.2 RJ1.4
$C79_2: C79.2 RJ1.5
$C83_2: C83.2 Q12.1 R99.1 R100.1
$C92_2: C92.2 U33.4
$C93_2: C93.2 R119.2 U33.5
$C100_2: C100.2 U37.4
$C105_2: C105.2 R125.1 U38.10
$D1_1: D1.1 Q3.3 R8.2
$D2_2: D2.2 Q9.3 R29.2
$D7_2: D7.2 R110.2 R111.2 U16.3
$D8_1: D8.1 R112.1 R124.2 U15.3
$D9_2: D9.2 K1.1 Q12.3
$Q1_1: Q1.1 Q3.2 R5.1
$Q1_3: Q1.3 Q3.1 R7.2
$Q2_1: Q2.1 R37.2 R38.2
$Q2_3: Q2.3 R30.2
$Q4_3: Q4.3 U34.7
$Q5_1: Q5.1 R17.1 R18.1 R22.2 R23.2
$Q5_3: Q5.3 Q6.2 Q6.4
$Q6_1: Q6.1 Q7.2 Q7.4 R22.1 R23.1
$Q6_3: Q6.3 Q7.1 R26.2
$Q8_3: Q8.3 U34.4
$Q10_1: Q10.1 R35.1 R36.1
$Q10_3: Q10.3 R6.2
$Q11_1: Q9.2 Q11.1 R31.2
$Q11_3: Q9.1 Q11.3 R28.1
$R13_1: R13.1 R24.2 U34.3
$R14_1: R14.1 U39.A11
$R26_3: R26.3 R27.2
$R56_1: JTAG.6 R56.1
$R57_1: JTAG.4 R57.1
$R58_1: JTAG.2 R58.1
$R59_1: JTAG.10 R59.1
$R60_1: R60.1 RESET.3 RESET.4
$R72_1: R72.1 R74.1 U28.8
$R72_2: R72.2 R73.1 U28.9
$R80_1: R80.1 R82.1 U29.8
$R80_2: R80.2 R81.1 U29.9
$R88_2: R88.2 U29.13 U29.14
$R93_1: R93.1 RJ1.9
$R94_1: R94.1 RJ1.12
$R95_1: R95.1 U13.16
$R98_1: R98.1 RJ1.13
$R109_1: R109.1 RJ1.8 RJ1.14
$R114_1: R114.1 U32.8
$R115_1: R115.1 U32.7
$R116_1: R116.1 U32.6
$R118_2: R118.2 U32.5
$R120_1: R120.1 R121.1 U35.3
$R122_2: R122.2 R123.1 U35.2
$R126_1: R126.1 U39.A2
$R127_1: R127.1 U39.A3
$R128_1: R128.1 U39.B2
$R129_1: R129.1 U39.A10
$R130_1: R130.1 U39.B3
$R131_2: R131.2 U39.B11
$R132_1: R132.1 U39.B10
$R134_1: R134.1 U11.13
$R135_1: R135.1 U11.130
$R136_2: R136.2 U43.3
$R137_2: R137.2 U43.5
$R138_1: R138.1 U42.3
$R139_1: R139.1 U42.5
$R140_1: R140.1 U44.3
$R141_1: R141.1 U45.7
$R142_1: R142.1 U45.6
$R143_1: R143.1 U45.5
$R145_2: R145.2 U45.2
$R146_2: R146.2 U45.3
$R147_1: R147.1 U11.63
$R148_1: R148.1 U11.60
$TP1_1: TP1.1 U11.104
$TP2_1: TP2.1 U11.85
ADC_CLK: R135.2 TP7.1 U20.4 U21.4
ADC_CS1_SPI1_NPCS2: TP4.1 U11.16 U21.6
ADC_CS2_SPI1_NPCS3: TP5.1 U11.15 U20.6
AFE0_AD0: EXPAND.9 U11.34
AFE0_AD1: EXPAND.8 U11.32
BLAH: WAVESHARE.8
CC1: U39.A5
CC2: U39.B5
DAC_CLR: R118.1 TP10.1 U11.19
DAC_OUT_A: TP8.1 U32.1
DAC_OUT_B: R120.2 TP9.1 U32.2
DAC_UREF: C94.2 R123.2 TP11.1 U32.10
DM-: R62.1 U39.A7 U39.B7
DP+: R133.1 U39.A6 U39.B6
ETH_RXM-: RJ1.6 U13.3
ETH_RXP+: RJ1.3 U13.4
ETH_TXM-: RJ1.2 U13.5
ETH_TXP+: RJ1.1 U13.6
ETHLEDG: R96.1 RJ1.10 U13.23
GATE_A: Q4.2 Q4.4 Q5.2 Q5.4 R3.1 R4.1 R6.1 R17.2 R18.2
GATE_B: Q7.3 Q8.2 Q8.4 R27.1 R30.1 R32.2 R33.2
HGND: C104.2 C105.1 C107.1 NOREF#8.1 R14.2 R126.2 R127.2 R128.2 R129.2 R130.2 R131.1 R132.2 U38.13 U38.17 U39.1 U39.2 U39.3 U39.4 U39.A1 U39.A12 U39.B1 U39.B12 U42.4 U44.4
KEY: JTAG.7
LCD_DC: U11.57 WAVESHARE.6
LCD_RST: U11.52 WAVESHARE.7
LN_3V3: C95.2 R119.1 TP20.1 U32.9
LOCAL_GND: K1.2 R68.1
LOCAL_SENSE: K1.9 R67.1 R68.2
NRESET: C23.2 R59.2 R60.2 TP3.1 U11.83
PA14_PHYINT: R106.1 U11.124 U13.18
PB1: HMI.1 U11.88
PB2: HMI.3 U11.99
PB3: HMI.5 U11.101
PB4: HMI.7 U11.102
PB5: HMI.2 U11.97
PB6: HMI.4 U11.98
PB7: HMI.6 U11.100
PB8: HMI.8 U11.106
PC4_GPIO: EXPAND.2 U11.41
PC8_LANLED: RJ1.11 U11.82
PC10_PHYRST: C89.2 R105.1 U11.90 U13.24
PD0_PHYRCLK: R95.2 U11.1
PD1_PHYTXEN: U11.132 U13.19
PD2_PHYTX0: U11.131 U13.20
PD3_PHYTX1: U11.128 U13.21
PD4_PHYAD1: R108.2 U11.126 U13.15
PD5_PHYRX0: U11.125 U13.13
PD6_PHYRX1: U11.121 U13.12
PD7_PHYRXER: U11.119 U13.17
PD8_MDC: U11.113 U13.11
PD9_MDIO: R107.1 U11.110 U13.10
PHY_XI: C85.2 U13.8 U31.1
PHY_XO: C84.2 U13.7 U31.3
PWMC0_PWMH1: EXPAND.1 U11.93
PWMC0_PWMH3: EXPAND.7 U11.35
PWMC0_PWML1: EXPAND.3 U11.38
PWMC0_PWML2: EXPAND.6 U11.39
PWMC0_PWML3: EXPAND.4 U11.40
PWMC1_PWMH3: EXPAND.5 U11.36
QCS: U11.64 U45.1
QIO0: R143.2 U11.42
QIO1: R145.1 U11.68
QIO2: R146.1 U11.25
QIO3: R141.2 U11.2
QSCK: R142.2 U11.51
REMOTE_GND: D13.1 K1.4 R102.1 R104.2
REMOTE_SENSE: D13.2 K1.7 R101.1 R103.2
REXT: C82.1 R97.1 U13.9
RSM: R102.2 REMOTE_SENSE1.2
RSP: R101.2 REMOTE_SENSE1.1
SCL: U11.77
SDA: U11.91
SENSE_DIR: R100.2 U11.103
SPI0_MISO: U11.65
SPI0_MOSI: R147.2 WAVESHARE.3
SPI0_NPCS0: U11.26
SPI0_NPCS1: U11.55 WAVESHARE.5
SPI0_NPCS2: U11.92
SPI0_NPCS3: U11.47
SPI0_SPCK: R148.2 WAVESHARE.4
SPI1_MISO: R134.2 TP6.1 U20.5 U21.5
SSC_TD: R114.2 TP19.1 U11.53
SSC_TF: R116.2 TP17.1 U11.21
SSC_TK: R115.2 TP18.1 U11.20
SUB1: U39.A8
SUB2: U39.B8
SWDCLK: R57.2 U11.89
SWDIO: R58.2 U11.79
SWO: R56.2 U11.109
U075: C68.1 C69.1 R89.2 TP16.1 U28.10 U29.10
UART_RESET: R140.2 U11.73
UOH: D10.2 D11.2 OUT_PWR1.1 Q2.2 Q10.2 R9.2 R10.2 R11.2 R12.2 R15.2 R19.2 R20.2 R21.2 R67.2 R103.1 TP29.1
UOL: D10.1 D12.2 OUT_PWR1.2 R91.2 R92.2 R104.1 TP31.1 U29.3
URX: R139.2 U38.4
URXD0: R137.1 U11.75
USB_DM: R62.2 U38.11
USB_DP: R133.2 U38.12
USENSE: K1.8 U28.3
USETIN: R13.2 R122.1 TP13.1 U35.6
UTX: R136.1 U38.5
UTXD0: R138.2 U11.66
UXRES: R125.2 U44.5
XIN: C22.2 U11.142 U12.1
XOUT: C21.2 U11.141 U12.3

Pads without a net: F 1; F1 1; F2 1; F3 1; JTAG 8; K1 5 6; NOREF#2 1; NOREF#5 1; R26 1; RJ1 7; U11 4 6 7 10 11 12 14 17 18 22 23 24 27 28 31 37 45 46 48 49 54 56 58 59 62 67 69 70 71 74 76 78 84 86 87 94 105 108 111 112 114 116 117 118 120 122 127 129 133 136 137 144; U34 1 5 8; U35 1 5 8; U38 1 2 3 6 7 8 9 14 15

## Via types
v1: diameter 0.599, hole 0.305, Top Layer to Bottom Layer, 449 vias
v2: diameter 0.6, hole 0.305, Top Layer to Bottom Layer, 288 vias

## Routing (per net, layer and track width the routed paths; a pad name or vN(x,y) marks a point on that pad's centre or on a via; arc(x,y) is an arc through that point)
1V2: length 3.1
  Top Layer w0.25: U13.1 28.18,52.05 29.21,53.09 C88.1
3V3: length 247.5
  Top Layer w0.2: C90.1 24.41,45.97 25.73,47.28 U13.14 ; TP22.1 7.13,13.08 7.87,13.81 C29.2 ; C26.2 30.23,5.97 U11.72 ; C108.2 51.08,4.33 U45.8 ; R96.2 33.91,57.32 33.94,57.36 ; 30.61,34.54 v2(30.61,35.56) ; U11.143 13.23,31.19 12.42,32 11.56,32 10.42,30.86 C30.2 ; JTAG.1 40.51,17.02 39.75,17.78 34.17,17.78 v2(34.06,17.67) ; C31.2 7.9,26.3 ; v2(34.06,20.83) 34.18,20.7 C25.2 ; v2(9.25,26.3) 10.66,26.3 10.67,26.31 U11.5 ; v2(15.99,7.5) 15.73,7.75 U11.43 ; C27.2 34.44,13.85 v2(34.06,14.23) 33.97,14.31 U11.80 ; C32.2 18.05,32.26 v2(17.8,32.01) 17.73,31.94 U11.134 ; C33.2 34.99,22.31 v2(34.06,22.31) U11.96 ; U44.1 36.83,65.48 v1(36.83,66.17) ; U11.30 v2(9.38,13.81)
  Top Layer w0.25: R93.2 R94.2 ; C87.1 27.69,53.09 27.57,53.09 27.23,52.75 U13.2
  Top Layer w0.3: U30.3 9.81,30.89 C30.2 ; U11.9 7.72,24.31 C42.2 7.89,24.63 C31.2
  Top Layer w0.4: C108.2 v1(50.04,4.32) ; v2(15.99,7.5) 16.02,7.46 C28.2 ; C29.2 9.35,13.84 v2(9.38,13.81) ; R106.2 v2(29.21,47.74) ; C26.2 31.12,5.96 31.75,5.33 v1(42.8,5.33) 42.8,7.11 43.94,8.25 46.99,8.25 49.53,10.79 58.67,10.79 HMI.9
  Top Layer w0.5: v2(21.97,46.23) 16.13,46.23 14.73,44.83 v1(11.68,44.83) 11.68,41.02 9.91,39.24 9.91,33.31 U30.3 ; R94.2 32.64,71.11 v1(32.64,70.23) 32.64,59.24 33.94,57.94 33.94,57.36 ; U42.1 36.77,69.61 v1(36.77,70.43) 36.77,71.23 U43.6 35.44,71.25 C106.2 ; v2(24.38,46.99) C90.1 ; v2(36.58,53.21) v2(36.58,57.4) ; R105.2 v2(30.73,57.4)
  Top Layer w0.6: 9.79,29.84 v2(9.79,29.21) v2(9.16,29.21) 9.79,29.84 ; 9.79,29.84 C30.2 ; 7.9,26.3 v2(9.25,26.3)
  Bottom Layer w0.2: v1(36.83,66.17) 36.83,70.37 v1(36.77,70.43)
  Bottom Layer w0.4: v1(11.68,44.83) 8.89,44.83 WAVESHARE.1 ; v1(50.04,4.32) 49.02,5.33 v1(42.8,5.33)
  Bottom Layer w0.5: 29.97,53.22 31.23,53.22 v2(31.23,53.23) 36.56,53.23 v2(36.58,53.21) 36.58,52.2 36.96,51.81 36.96,48.13 36.57,47.74 v2(29.21,47.74) 28.46,46.99 v2(24.38,46.99) 22.73,46.99 v2(21.97,46.23) ; 29.97,53.22 v2(27.69,53.22) ; 29.97,53.22 v2(29.97,53.21) ; 32.64,70.27 32.67,70.27 32.83,70.43 v1(36.77,70.43) ; v2(36.58,57.4) 33.91,57.4 ; v2(33.91,57.4) v2(30.73,57.4)
  Bottom Layer w0.6: 12.7,28.07 11.85,28.07 10.7,29.21 v2(9.79,29.21) v2(9.16,29.21) ; 30.23,14.23 v2(34.06,14.23) v2(34.06,17.67) v2(34.06,20.83) v2(34.06,22.31) ; v2(9.25,26.3) 12.7,26.3 ; v2(15.99,7.5) 15.24,8.24 15.24,10.79 ; 30.1,10.92 30.25,10.77 v2(30.25,7.12) ; 18.16,28.32 18.16,29.21 17.8,29.57 v2(17.8,32.01) ; v2(30.61,35.56) 30.61,31.5 28.83,29.72 28.83,28.45 ; 12.7,13.81 v2(9.38,13.81)
3V3_REF: length 56.1
  Top Layer w0.4: U21.1 153.43,37 153.95,36.47 C102.2 155.81,36.19 155.81,34.9 ; 155.81,34.9 157.68,33.02 157.68,18.77 156.76,17.84 C103.2 155.32,17.88 154.88,17.88 154.25,18.52 153.12,18.52 U20.1 ; 155.81,34.9 148.79,34.9 146.45,37.25 143.38,37.25 143.41,37.28 C101.2 143.41,39.43 144.24,40.25 v2(144.24,42.97) ; v2(141.94,43.54) 141.94,46.3 142.5,46.87 142.5,48.39 143.23,49.12 U29.12
  Bottom Layer w0.4: v2(144.24,42.97) 143.26,42.97 142.7,43.54 v2(141.94,43.54)
+5V: length 322.8
  Top Layer w0.2: 136.41,18.67 136.4,18.66 136.4,10.03 TP14.1
  Top Layer w0.4: U33.1 39.3,53.65 38.56,52.91 38.4,52.91 ; v2(42.42,39.5) 41.53,40.39 41.53,42.02 ; 38.4,52.91 39.56,51.75 40.34,51.75 ; 38.4,52.91 C98.2 ; 139.39,37.25 140.49,37.25 ; 139.39,37.25 138.15,37.25 C47.2 ; 139.39,37.25 139.39,35.66 139.71,35.35 141.82,35.35 v2(141.86,35.31) ; D9.1 116.8,16.21 K1.10 ; U28.4 v2(140.67,27.41)
  Top Layer w0.6: K1.10 119.25,18.67 141.35,18.67 141.86,19.18 v2(141.86,35.31) ; U29.4 v2(140.67,47.85) 140.89,48.08 140.89,49.89 141.61,50.6 141.61,53.09 140.07,54.62 R111.1
  Top Layer w1: v2(37.59,55.12) 38.23,54.48 ; v2(37.59,55.12) 37.53,55.12 ; v2(37.59,55.12) v2(38.23,55.12) 38.23,54.48 ; 38.23,54.48 C98.2 38.25,52.94 ; C99.2 3.39,31.21 5.21,33.03 U30.1 5.21,36.19 4.32,37.08 4.32,50.55 5.19,51.42 v1(15.89,51.42) v1(16.51,51.42) ; v1(53.85,41.27) v1(53.21,41.27) v1(52.58,41.27) 46.23,41.27 45.77,40.81 C97.1 v2(43.05,39.5) v2(42.42,39.5) ; 140.07,58.8 135.76,58.8 132.08,55.12 107.82,55.12 104.14,58.8 90.65,58.8 89.5,59.94 73.28,59.94 63.75,50.42 v1(57.66,50.42) v1(57.02,50.42) v1(56.39,50.42)
  Inner1 w1: v1(56.39,50.42) v1(57.02,50.42) v1(57.66,50.42) ; v1(52.58,41.27) v1(53.21,41.27) v1(53.85,41.27) ; v1(15.89,51.42) v1(16.51,51.42) ; v2(37.59,55.12) v2(38.23,55.12)
  Inner2 w1: v1(57.66,50.42) v1(57.02,50.42) v1(56.39,50.42) ; v1(15.89,51.42) v1(16.51,51.42) ; v2(37.59,55.12) v2(38.23,55.12) 38.23,55.11 38.23,55.09 37.55,55.09 37.53,55.12 ; v1(52.58,41.27) v1(53.21,41.27) v1(53.85,41.27)
  Bottom Layer w0.4: C65.2 140.46,48.06 v2(140.67,47.85) 140.46,47.64 C74.2 139.81,45.81 139.81,42.34 141.86,40.29 v2(141.86,35.31) 140.33,33.78 C75.2 140.33,27.59 140.52,27.41 v2(140.67,27.41) 140.33,27.07 C66.2
  Bottom Layer w1: v2(37.59,55.12) 21.57,55.12 17.87,51.42 v1(16.51,51.42) v1(15.89,51.42) ; v2(37.59,55.12) 38.23,54.48 ; v2(37.59,55.12) v2(38.23,55.12) 38.23,54.48 ; v1(53.21,41.27) v1(53.85,41.27) 53.21,41.91 ; v1(53.21,41.27) 53.21,41.91 ; v1(53.21,41.27) v1(52.58,41.27) 53.21,41.91 ; v2(43.05,39.5) v2(42.42,39.5) 40.36,41.56 40.36,51.46 38.23,53.59 38.23,54.48 ; v1(57.66,50.42) v1(57.02,50.42) v1(56.39,50.42) 52.66,46.69 52.66,43.66 53.21,43.11 53.21,41.91
-5V: length 177.6
  Top Layer w0.4: U29.11 v2(143.2,47.85) ; U28.11 v2(143.08,27.41)
  Top Layer w0.6: v2(143.8,6.73) 143.76,6.69 ; v2(143.8,6.73) 143.76,6.73 143.76,6.69 ; v2(143.8,6.73) v2(144.4,6.73) ; 143.76,6.69 R124.1 143.76,4.18 141.48,1.91 TP15.1 120.39,1.91 104.64,17.65 88.52,17.65 87.8,16.93 86.95,16.93 84.45,19.43 57.93,19.43 57.23,20.13 49.97,20.13 46.74,23.37 45.72,23.37 43.31,25.78 43.31,34.67 44.07,35.43 U35.4 44.07,36.83 45.77,36.83 C96.2
  Bottom Layer w0.4: C66.1 143.29,27.2 v2(143.08,27.41) 143.29,27.62 C75.1 143.29,40.67 145.16,42.54 145.16,43.43 143.41,45.18 C74.1 143.41,47.64 v2(143.2,47.85) 143.41,48.06 C65.1
  Bottom Layer w0.6: C66.1 143.29,24.44 143.8,23.93 143.8,7.33 ; 143.8,7.33 v2(144.4,6.73) v2(143.8,6.73) 143.8,7.33
